# Altium schematic sheet [02] - BLOCK DIAGRAM.SchDoc
size A
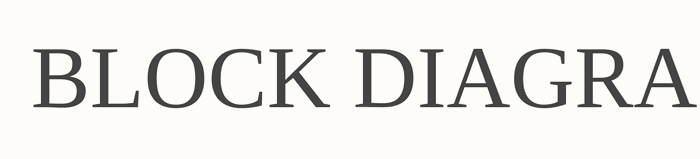
[diagram p0: [02] - BLOCK DIAGRAM.SchDoc]

## Notes on the sheet
- BLOCK DIAGRAM